# Altium schematic sheet 05_I2C_RTC.SchDoc
size A4
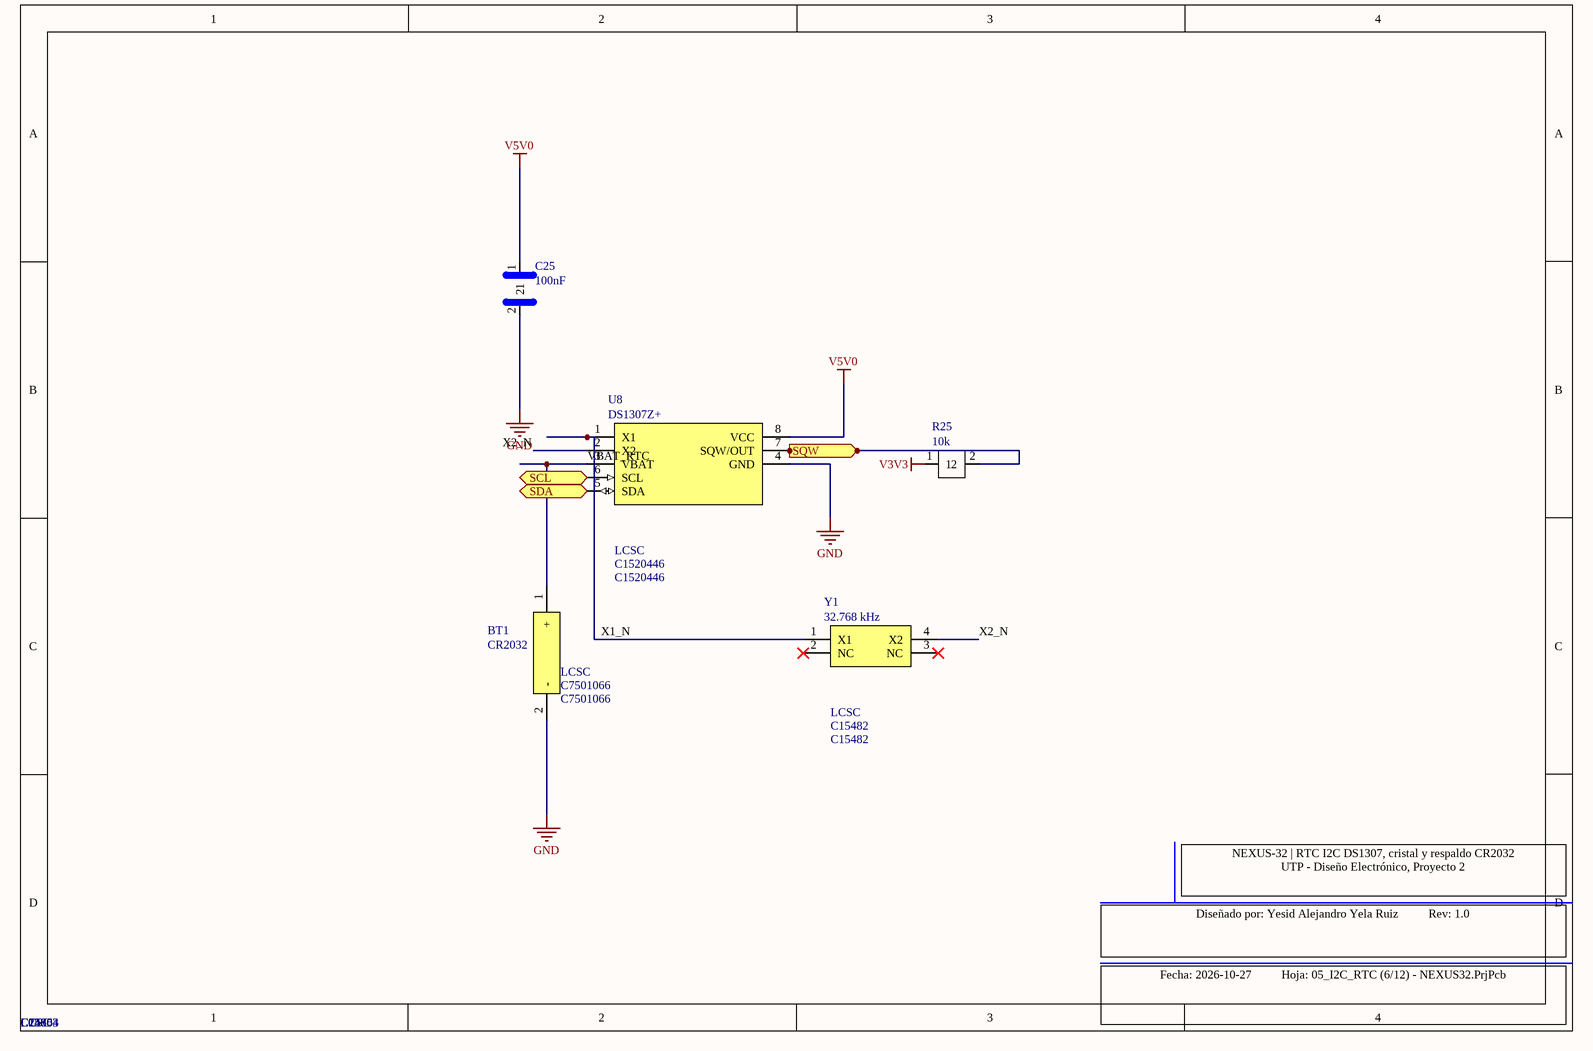
[diagram p0: 05_I2C_RTC.SchDoc]

## Parts
BT1  CR2032  Supplier 1: LCSC  Supplier Part Number 1: C7501066  [BAT-HLD-001]
C25  100nF  Supplier 1: LCSC  Supplier Part Number 1: C14663  [R_0603]
R25  10k  Supplier 1: LCSC  Supplier Part Number 1: C25804  [R_0603]
U8  DS1307Z+  Supplier 1: LCSC  Supplier Part Number 1: C1520446  [SOIC-8_3.9x4.9_P1.27]
Y1  32.768 kHz  Supplier 1: LCSC  Supplier Part Number 1: C15482  [XTAL_MC-146]

## Ports
SCL (bidir), SDA (bidir), SQW (out)

## Nets
GND: BT1.2(-) C25.2 U8.4(GND)
V3V3: R25.1
V5V0: C25.1 U8.8(VCC)
SCL: U8.6(SCL) ; port SCL
SDA: U8.5(SDA) ; port SDA
SQW: R25.2 U8.7(SQW/OUT) ; port SQW
VBAT_RTC: BT1.1(+) U8.3(VBAT)
X1_N: U8.1(X1) Y1.1(X1)
X2_N: U8.2(X2) Y1.4(X2)

Not connected (* = marked no-connect by the designer): Y1 2(NC)* 3(NC)*

## Notes on the sheet
- NEXUS-32 | RTC I2C DS1307, cristal y respaldo CR2032
  UTP - Diseño Electrónico, Proyecto 2
- Diseñado por: Yesid Alejandro Yela Ruiz          Rev: 1.0
- Fecha: 2026-10-27          Hoja: 05_I2C_RTC (6/12) - NEXUS32.PrjPcb

## Library data of the parts
BT1 = BAT-HLD-001: Portapilas CR2032 SMD (TE BAT-HLD-001); pad 1 = (+) dos pestanas laterales, pad 2 = (-) pad central; Manufacturer: TE Connectivity; Manufacturer Part Number: BAT-HLD-001; LCSC Part #: C7501066; Datasheet: https://wmsc.lcsc.com/wmsc/upload/file/pdf/v2/lcsc/2411212321_TE-Connectivity-BAT-HLD-001_C7501066.pdf
C25 = CAP_0603: Condensador ceramico SMD 0603; Manufacturer: YAGEO; Manufacturer Part Number: CC0603KRX7R9BB104; Datasheet: https://wmsc.lcsc.com/wmsc/upload/file/pdf/v2/lcsc/2206010045_UNI-ROYAL-Uniroyal-Elec-0603WAF1002T5E_C25804.pdf; LCSC Part #: C14663
R25 = RES_0603: Resistencia SMD 0603; Manufacturer: UNI-ROYAL; Manufacturer Part Number: 0603WAF1002T5E; Datasheet: https://wmsc.lcsc.com/wmsc/upload/file/pdf/v2/lcsc/2206010045_UNI-ROYAL-Uniroyal-Elec-0603WAF1002T5E_C25804.pdf; LCSC Part #: C25804
U8 = DS1307Z+: RTC I2C 64x8 SOIC-8 150mil (Analog Devices/Maxim DS1307Z+); Manufacturer: Analog Devices (Maxim Integrated); Manufacturer Part Number: DS1307Z+; LCSC Part #: C1520446; Datasheet: https://www.farnell.com/datasheets/29949.pdf
Y1 = XTAL_MC146: Cristal 32.768kHz 12.5pF MC-146 (Epson Q13MC14620002); terminales #1 y #4, #2/#3 sin conexion; Manufacturer: Epson; Manufacturer Part Number: Q13MC14620002; LCSC Part #: C15482; Datasheet: https://wmsc.lcsc.com/wmsc/upload/file/pdf/v2/lcsc/2404180924_Seiko-Epson-Q13MC14620002_C15482.pdf